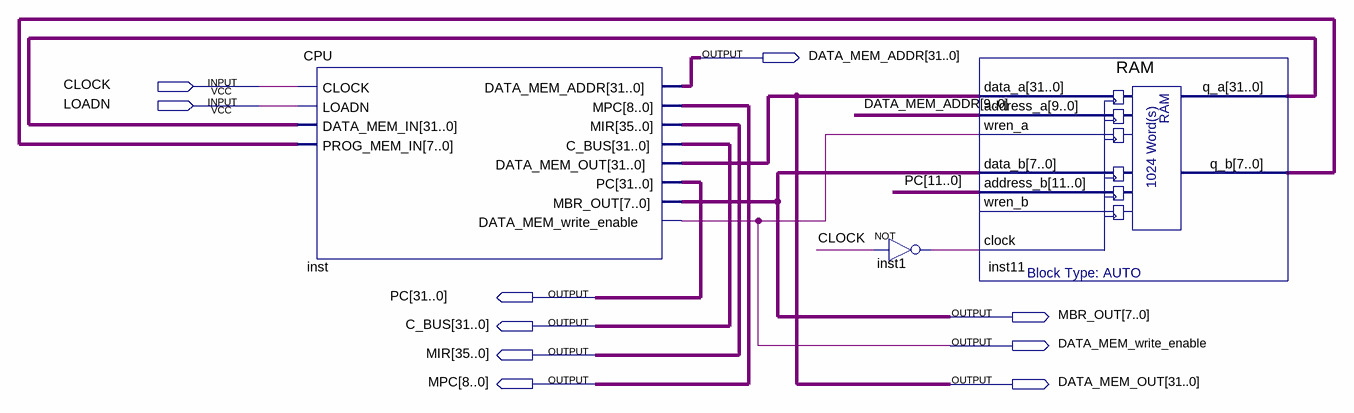
[diagram p0: schematic sheet]
// Quartus schematic MIC1 (1).bdf as structural Verilog: 3 symbols, 10 pins
module \MIC1_(1)  (
  input  CLOCK,
  input  LOADN,
  output [31:0] DATA_MEM_ADDR,
  output [31:0] PC,
  output [7:0] MBR_OUT,
  output [31:0] C_BUS,
  output DATA_MEM_write_enable,
  output [35:0] MIR,
  output [8:0] MPC,
  output [31:0] DATA_MEM_OUT
);

  wire inst1_out;
  wire [7:0] inst11_q_b;
  wire [31:0] inst11_q_a;

  CPU inst (
    .CLOCK(CLOCK), .LOADN(LOADN), .DATA_MEM_IN(inst11_q_a), .PROG_MEM_IN(inst11_q_b),
    .DATA_MEM_ADDR(DATA_MEM_ADDR), .MPC(MPC), .MIR(MIR), .C_BUS(C_BUS), .DATA_MEM_OUT(DATA_MEM_OUT), .PC(PC),
    .MBR_OUT(MBR_OUT), .DATA_MEM_write_enable(DATA_MEM_write_enable));
  not inst1 (inst1_out, CLOCK);
  RAM inst11 (
    .data_a(DATA_MEM_OUT), .address_a(DATA_MEM_ADDR[9:0]), .wren_a(DATA_MEM_write_enable), .data_b(MBR_OUT),
    .address_b(PC[11:0]), .clock(inst1_out), .q_a(inst11_q_a), .q_b(inst11_q_b));  // open: wren_b
endmodule
